# Altium schematic sheet SFP_Group.SchDoc: SFP_Group
size A3
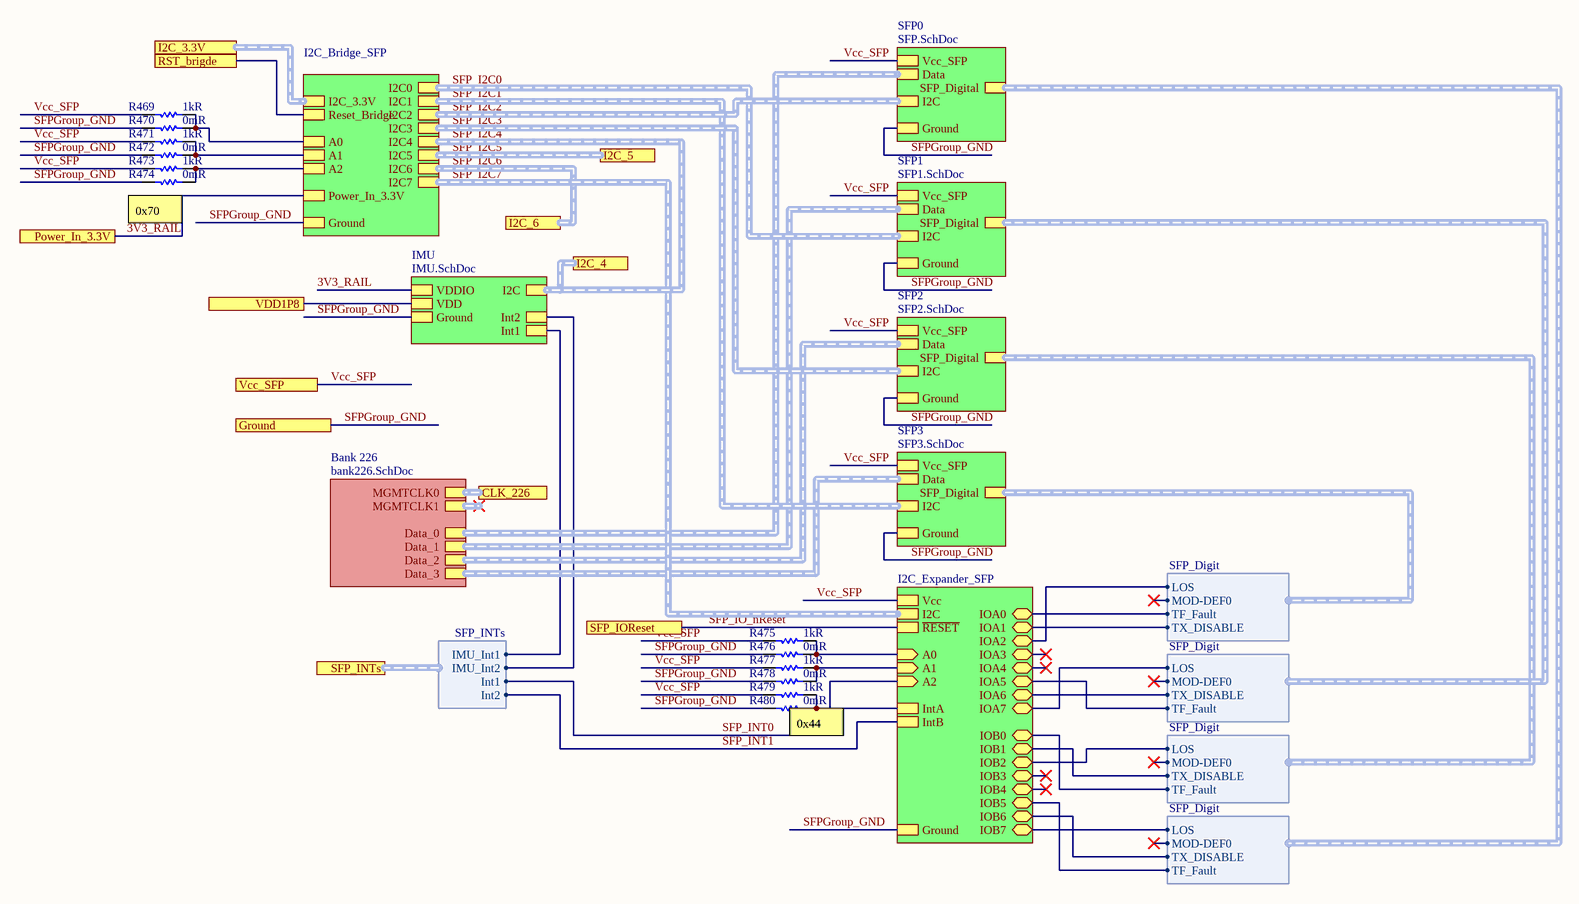
[diagram p0: SFP_Group.SchDoc]

## Parts
R469  1kR  [RES 0402/1005 RF KK]
R470  0mR  [RES 0402/1005 RF KK]
R471  1kR  [RES 0402/1005 RF KK]
R472  0mR  [RES 0402/1005 RF KK]
R473  1kR  [RES 0402/1005 RF KK]
R474  0mR  [RES 0402/1005 RF KK]
R475  1kR  [RES 0402/1005 RF KK]
R476  0mR  [RES 0402/1005 RF KK]
R477  1kR  [RES 0402/1005 RF KK]
R478  0mR  [RES 0402/1005 RF KK]
R479  1kR  [RES 0402/1005 RF KK]
R480  0mR  [RES 0402/1005 RF KK]

## Sub-sheets
Bank 226 = bank226.SchDoc: MGMTCLK0 (harness Diff_1Pair), MGMTCLK1 (harness Diff_1Pair), Data_3 (harness Diff_2PairData), Data_2 (harness Diff_2PairData), Data_1 (harness Diff_2PairData), Data_0 (harness Diff_2PairData)
I2C_Bridge_SFP = I2C_Bridge.SchDoc: I2C0 (harness I2C), I2C1 (harness I2C), I2C2 (harness I2C), I2C3 (harness I2C), I2C4 (harness I2C), I2C5 (harness I2C), I2C6 (harness I2C), I2C7 (harness I2C), A2, A1, A0, Ground, I2C_3.3V (harness I2C), Reset_Bridge, Power_In_3.3V
I2C_Expander_SFP = I2C_Expander.SchDoc: IOA7 (bidir), IOA3 (bidir), IOA6 (bidir), IOA1 (bidir), IOA0 (bidir), IOA5 (bidir), IOB1 (bidir), IOB2 (bidir), IOB5 (bidir), IOB6 (bidir), IOB7 (bidir), IntA, IntB, Ground, IOB4 (bidir), IOB3 (bidir), IOA2 (bidir), IOA4 (bidir), IOB0 (bidir), Vcc, ~{RESET}, I2C (harness I2C), A2 (in), A1 (in), A0 (in)
IMU = IMU.SchDoc: Ground, I2C (harness I2C), VDDIO, VDD, Int1, Int2
SFP0 = SFP.SchDoc: I2C (harness I2C), Vcc_SFP, SFP_Digital (harness SFP_Digit), Data (harness Diff_2PairData), Ground
SFP1 = SFP1.SchDoc: I2C (harness I2C), Vcc_SFP, SFP_Digital (harness SFP_Digit), Data (harness Diff_2PairData), Ground
SFP2 = SFP2.SchDoc: I2C (harness I2C), Vcc_SFP, SFP_Digital (harness SFP_Digit), Data (harness Diff_2PairData), Ground
SFP3 = SFP3.SchDoc: I2C (harness I2C), Vcc_SFP, SFP_Digital (harness SFP_Digit), Data (harness Diff_2PairData), Ground

## Ports
CLK_226 (harness Diff_1Pair), Ground, I2C_3.3V (harness I2C), I2C_4 (harness I2C), I2C_5 (harness I2C), I2C_6 (harness I2C), Power_In_3.3V, RST_brigde, SFP_INTs (harness SFP_INTs), SFP_IOReset, Vcc_SFP, VDD1P8

## Harnesses
SFP_Digit: LOS, MOD-DEF0, TF_Fault, TX_DISABLE
SFP_INTs: IMU_Int1, Int1, Int2, IMU_Int2

## Nets
3V3_RAIL: port Power_In_3.3V, sheet I2C_Bridge_SFP/Power_In_3.3V, sheet IMU/VDDIO
RST_brigde: port RST_brigde, sheet I2C_Bridge_SFP/Reset_Bridge
SFP_INT0: sheet I2C_Expander_SFP/IntA, port SFP_INTs.Int1
SFP_INT1: sheet I2C_Expander_SFP/IntB, port SFP_INTs.Int2
SFP_IO_nReset: port SFP_IOReset, sheet I2C_Expander_SFP/~{RESET}
SFPGroup_GND: R470.2 R472.2 R474.2 R476.2 R478.2 R480.2 ; port Ground, sheet SFP0/Ground, sheet SFP1/Ground, sheet SFP2/Ground, sheet SFP3/Ground, sheet I2C_Bridge_SFP/Ground, sheet IMU/Ground, sheet I2C_Expander_SFP/Ground
Vcc_SFP: R469.1 R471.1 R473.1 R475.1 R477.1 R479.1 ; port Vcc_SFP, sheet SFP0/Vcc_SFP, sheet SFP1/Vcc_SFP, sheet SFP2/Vcc_SFP, sheet SFP3/Vcc_SFP, sheet I2C_Expander_SFP/Vcc
VDD1P8: port VDD1P8, sheet IMU/VDD
NetR469_2: R469.2 R470.1 ; sheet I2C_Bridge_SFP/A0
NetR471_2: R471.2 R472.1 ; sheet I2C_Bridge_SFP/A1
NetR473_2: R473.2 R474.1 ; sheet I2C_Bridge_SFP/A2
NetR475_2: R475.2 R476.1 ; sheet I2C_Expander_SFP/A0
NetR477_2: R477.2 R478.1 ; sheet I2C_Expander_SFP/A1
NetR479_2: R479.2 R480.1 ; sheet I2C_Expander_SFP/A2
(unnamed): sheet IMU/Int1, port SFP_INTs.IMU_Int1
(unnamed): sheet IMU/Int2, port SFP_INTs.IMU_Int2
(unnamed): sheet I2C_Expander_SFP/IOA7, sheet SFP1/SFP_Digital.LOS
(unnamed): sheet I2C_Expander_SFP/IOA6, sheet SFP1/SFP_Digital.TX_DISABLE
(unnamed): sheet I2C_Expander_SFP/IOA1, sheet SFP3/SFP_Digital.TX_DISABLE
(unnamed): sheet I2C_Expander_SFP/IOA0, sheet SFP3/SFP_Digital.TF_Fault
(unnamed): sheet I2C_Expander_SFP/IOA5, sheet SFP1/SFP_Digital.TF_Fault
(unnamed): sheet I2C_Expander_SFP/IOB1, sheet SFP2/SFP_Digital.TX_DISABLE
(unnamed): sheet I2C_Expander_SFP/IOB2, sheet SFP2/SFP_Digital.LOS
(unnamed): sheet I2C_Expander_SFP/IOB5, sheet SFP0/SFP_Digital.TF_Fault
(unnamed): sheet I2C_Expander_SFP/IOB6, sheet SFP0/SFP_Digital.TX_DISABLE
(unnamed): sheet I2C_Expander_SFP/IOB7, sheet SFP0/SFP_Digital.LOS
(unnamed): sheet I2C_Expander_SFP/IOA2, sheet SFP3/SFP_Digital.LOS
(unnamed): sheet I2C_Expander_SFP/IOB0, sheet SFP2/SFP_Digital.TF_Fault

## Buses and harness runs
harness port CLK_226 = sheet Bank 226/MGMTCLK0
harness port I2C_3.3V = sheet I2C_Bridge_SFP/I2C_3.3V
harness SFP_I2C0 = sheet I2C_Bridge_SFP/I2C0 = sheet SFP1/I2C
harness SFP_I2C1 = sheet I2C_Bridge_SFP/I2C1 = sheet SFP3/I2C
harness SFP_I2C2 = sheet I2C_Bridge_SFP/I2C2 = sheet SFP0/I2C
harness SFP_I2C3 = sheet I2C_Bridge_SFP/I2C3 = sheet SFP2/I2C
harness SFP_I2C4 = port I2C_4 = sheet I2C_Bridge_SFP/I2C4 = sheet IMU/I2C
harness SFP_I2C5 = port I2C_5 = sheet I2C_Bridge_SFP/I2C5
harness SFP_I2C6 = port I2C_6 = sheet I2C_Bridge_SFP/I2C6
harness SFP_I2C7 = sheet I2C_Bridge_SFP/I2C7 = sheet I2C_Expander_SFP/I2C
harness sheet Bank 226/Data_0 = sheet SFP0/Data
harness sheet Bank 226/Data_1 = sheet SFP1/Data
harness sheet Bank 226/Data_2 = sheet SFP2/Data
harness sheet Bank 226/Data_3 = sheet SFP3/Data

## Notes on the sheet
- (near R474) 0x70
- (near R480) 0x44
- Title
- Size:
- Date:
- A3
- Number:
- Time:
- Revision:
- Sheet
- of
- File:

## Library data of the parts
R469 R471 R473 R475 R477 R479 = Resistor: PANASONIC - ERJ-2RKF1001X - SMD Chip Resistor, 0402 [1005 Metric], 1 kohm, ERJ2R Series, 50 V, Thick Film, 100 mW; Temperature Coefficient: 100ppm/°C; Tolerance: 1%; Voltage Rating (DC): 50V; Power Rating: 100mW; Supplier 1: Digi-Key; Supplier Part Number 1: P1.00KLDKR-ND; Manufacturer: Panasonic; Manufacturer Part Number: ERJ-2RKF1001X; RoHS: Yes; Category: Chip SMD Resistors; Stock 1: 1864188; Pricing 1: 1=0,10000, 10=0,04300, 100=0,01740, 1000=0,00782, 2500=0,00678, 5000=0,00561 (USD); Mount: Surface Mount; Case/Package: 0402; Number of Pins: 2; Contact Plating: Tin; Case Code (Imperial): 0402; Case Code (Metric): 1005; Min Operating Temperature: -55°C; Max Operating Temperature: 155°C; Composition: Thick Film; Resistance: 1kR; Termination: SMD/SMT; Number of Terminations: 2; Military Standard: Not; Features: Automotive AEC-Q200; Packaging: Tape and Reel; Voltage Rating: 50V; Package Quantity: 1; Max Power Dissipation: 100mW; Working Voltage: 50V; Length: 1mm; Height: 0.35mm; Depth: 0.5mm; Width: 0.5mm; Radiation Hardening: No; Lead Free: Lead Free; REACH SVHC: No SVHC; ComponentLink1URL: https://datasheet.ciiva.com/11821/0900766b80f80784-11821203.pdf?src-supplier=RSComponents; ComponentLink1Description: https://datasheet.ciiva.com/11821/0900766b80f80784-11821203.pdf?src-supplier=RSComponents; ComponentLink2URL: https://datasheet.ciiva.com/7942/aoa0000ce2-7942426.pdf?src-supplier=Element14; ComponentLink2Description: https://datasheet.ciiva.com/7942/aoa0000ce2-7942426.pdf?src-supplier=Element14; ComponentLink3URL: https://datasheet.ciiva.com/16523/aoa0000ce2-16523834.pdf?src-supplier=Avnet+Asia; ComponentLink3Description: https://datasheet.ciiva.com/16523/aoa0000ce2-16523834.pdf?src-supplier=Avnet+Asia; ComponentLink4URL: https://datasheet.ciiva.com/17215/aoa0000ce2-17215308.pdf?src-supplier=Avnet+Europe; ComponentLink4Description: https://datasheet.ciiva.com/17215/aoa0000ce2-17215308.pdf?src-supplier=Avnet+Europe; ComponentLink5URL: https://datasheet.ciiva.com/22673/1678782-22673916.pdf?src-supplier=Element14; ComponentLink5Description: https://datasheet.ciiva.com/22673/1678782-22673916.pdf?src-supplier=Element14; ComponentLink6URL: https://datasheet.ciiva.com/28532/1678782-28532109.pdf?src-supplier=Element14; ComponentLink6Description: https://datasheet.ciiva.com/28532/1678782-28532109.pdf?src-supplier=Element14; ComponentLink7URL: https://datasheet.ciiva.com/16767/70260748-16767559.pdf?src-supplier=Allied+Electronics; ComponentLink7Description: https://datasheet.ciiva.com/16767/70260748-16767559.pdf?src-supplier=Allied+Electronics; ComponentLink8URL: https://datasheet.ciiva.com/9198/aoa0000ce2-9198920.pdf?src-supplier=Avnet; ComponentLink8Description: https://datasheet.ciiva.com/9198/aoa0000ce2-9198920.pdf?src-supplier=Avnet; ComponentLink9URL: https://datasheet.ciiva.com/16771/70260748-16771979.pdf?src-supplier=Allied+Electronics; ComponentLink9Description: https://datasheet.ciiva.com/16771/70260748-16771979.pdf?src-supplier=Allied+Electronics
R470 R472 R474 R476 R478 R480 = Resistor: Manufacturer 1: Yageo; Manufacturer Part Number 1: RC0402JR-070RL; Power Rating: 62.5mW; Tolerance: 5%; Voltage Rating: 50V; Max Power Dissipation: 63mW; Temperature Coefficient: 200ppm/°C; Supplier 1: Digi-Key; Supplier Part Number 1: 311-0.0JRCT-ND; Stock 1: 69822252; Pricing 1: 1=0.10000, 10=0.01200, 25=0.00920, 50=0.00680, 100=0.00510, 250=0.00388, 500=0.00308, 1000=0.00227, 5000=0.00163 (USD); RoHS: Yes; Case/Package: 0402; Contact Plating: Tin,Matte; Case Code (Metric): 1005; Case Code (Imperial): 0402; Min Operating Temperature: -55°C; Max Operating Temperature: 155°C; Resistance: 0mR; Packaging: Tape and Reel; Composition: Thick Film; Package Quantity: 1; Number of Terminations: 2; Termination: SMD/SMT; Military Standard: Not; Features: Moisture Resistant; Length: 1mm; Height: 0.016inch; Width: 0.02inch; Depth: 0.5mm; Radiation Hardening: No; REACH SVHC: Unknown; Lead Free: Lead Free; ComponentLink1URL: https://datasheet.ciiva.com/2452/pyu-rc0402-51-rohs-l-6-2452608.pdf?src-supplier=Digi-Key; ComponentLink1Description: https://datasheet.ciiva.com/2452/pyu-rc0402-51-rohs-l-6-2452608.pdf?src-supplier=Digi-Key; ComponentLink2URL: https://datasheet.ciiva.com/11808/0900766b80c66297-11808195.pdf?src-supplier=RSComponents; ComponentLink2Description: https://datasheet.ciiva.com/11808/0900766b80c66297-11808195.pdf?src-supplier=RSComponents; ComponentLink3URL: https://datasheet.ciiva.com/2452/pyu-r-int-thick-7-2452609.pdf?src-supplier=Digi-Key; ComponentLink3Description: https://datasheet.ciiva.com/2452/pyu-r-int-thick-7-2452609.pdf?src-supplier=Digi-Key; ComponentLink4URL: https://datasheet.ciiva.com/22747/1018594-22747515.pdf?src-supplier=Element14; ComponentLink4Description: https://datasheet.ciiva.com/22747/1018594-22747515.pdf?src-supplier=Element14; ComponentLink5URL: https://datasheet.ciiva.com/7983/1018594-7983535.pdf?src-supplier=Element14; ComponentLink5Description: https://datasheet.ciiva.com/7983/1018594-7983535.pdf?src-supplier=Element14; ComponentLink6URL: https://datasheet.ciiva.com/2452/pyu-r-int-thick-7-2452610.pdf?src-supplier=Digi-Key; ComponentLink6Description: https://datasheet.ciiva.com/2452/pyu-r-int-thick-7-2452610.pdf?src-supplier=Digi-Key; ComponentLink7URL: https://datasheet.ciiva.com/8896/pyu-rc0402-51-rohs-l-6-8896201.pdf?src-supplier=Avnet; ComponentLink7Description: https://datasheet.ciiva.com/8896/pyu-rc0402-51-rohs-l-6-8896201.pdf?src-supplier=Avnet; ComponentLink8URL: https://datasheet.ciiva.com/28386/pyu-rc0402-51-rohs-l-6-28386633.pdf?src-supplier=Avnet+Europe; ComponentLink8Description: https://datasheet.ciiva.com/28386/pyu-rc0402-51-rohs-l-6-28386633.pdf?src-supplier=Avnet+Europe; ComponentLink9URL: https://datasheet.ciiva.com/15189/getdatasheetpartid-326379-15189533.pdf?src-supplier=Verical; ComponentLink9Description: https://datasheet.ciiva.com/15189/getdatasheetpartid-326379-15189533.pdf?src-supplier=Verical